# Altium project Smart_Station.PrjPcb
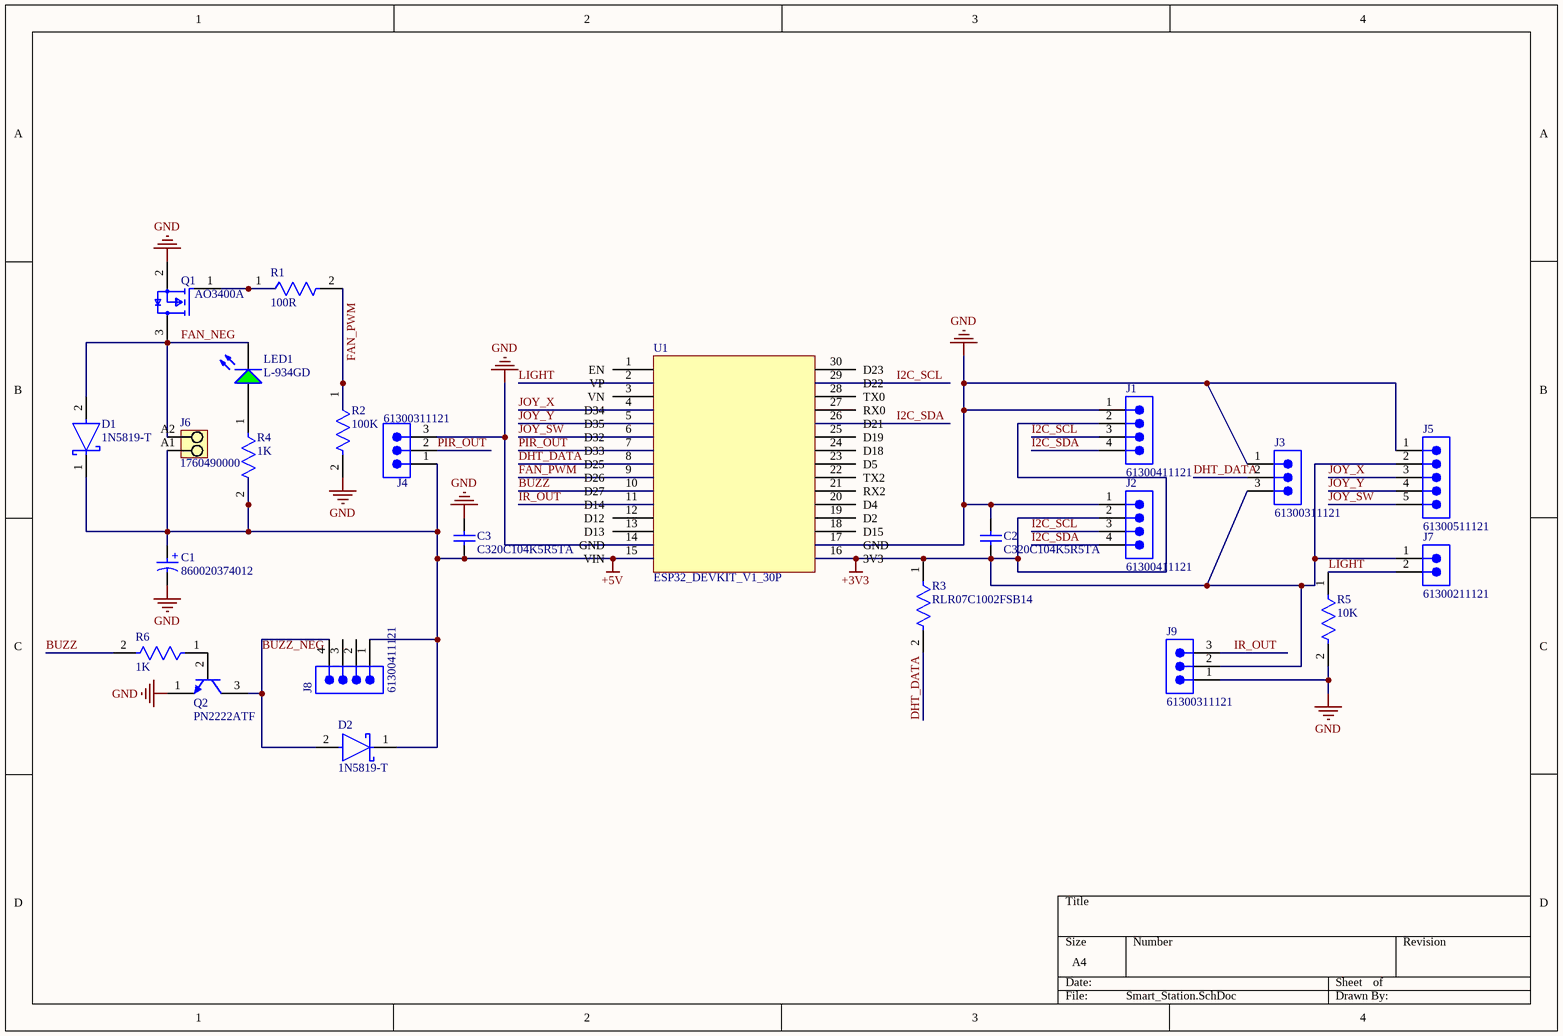
[diagram p0: Smart_Station.SchDoc]
1 sheet, 24 parts. Net scope: global (net labels, ports and power ports of the same name join across sheets).
Board file: Smart_Station.PcbDoc

## Sheet Smart_Station.SchDoc
size A4; SheetNumber: 1; SheetTotal: 1

### Parts
C1  860020374012  [WCAP-ATG5_D8H11.5]
C2  C320C104K5R5TA  [CAPR51-254-508X318X736]
C3  C320C104K5R5TA  [CAPR51-254-508X318X736]
D1  1N5819-T  [FP-DO-41_Plastic-MFG]
D2  1N5819-T  [FP-DO-41_Plastic-MFG]
J1  61300411121  [61300411121]
J2  61300411121  [61300411121]
J3  61300311121  [61300311121]
J4  61300311121  [61300311121]
J5  61300511121  [61300511121]
J6  1760490000  [PM_5_08_90_02]
J7  61300211121  [61300211121]
J8  61300411121  [61300411121]
J9  61300311121  [61300311121]
LED1  L-934GD  [KING-L-934GD]
Q1  AO3400A  [FP-SOT23-MFG]
Q2  PN2222ATF  [FAIR-TO-92-3]
R1  100R  [FP-RLR07-MFG]
R2  100K  [FP-RLR07-MFG]
R3  RLR07C1002FSB14  [FP-RLR07-MFG]
R4  1K  [FP-RLR07-MFG]
R5  10K  [FP-RLR07-MFG]
R6  1K  [FP-RLR07-MFG]
U1  ESP32_DEVKIT_V1_30P  [ESP32_DEVKIT_V1_30P]

### Nets
+3V3: C2.1 J1.2 J2.2 J3.3 J5.2 J7.1 J9.2 R3.1 U1.16(3V3)
+5V: C1.1(P) C3.1 D1.1(C) D2.1(C) J4.1 J6.A1 J8.1 R4.2 U1.15(VIN)
GND: C1.2(N) C2.2 C3.2 J1.1 J2.1 J3.1 J4.3 J5.1 J9.1 Q1.2(S) Q2.1(E) R2.2 R5.2 U1.14(GND) U1.17(GND)
BUZZ: R6.2 U1.10(D27)
BUZZ_NEG: D2.2(A) J8.4 Q2.3(C)
DHT_DATA: J3.2 R3.2 U1.8(D25)
FAN_NEG: D1.2(A) J6.A2 LED1.2(K) Q1.3(D)
FAN_PWM: R1.2 R2.1 U1.9(D26)
I2C_SCL: J1.3 J2.3 U1.29(D22)
I2C_SDA: J1.4 J2.4 U1.26(D21)
IR_OUT: J9.3 U1.11(D14)
JOY_SW: J5.5 U1.6(D32)
JOY_X: J5.3 U1.4(D34)
JOY_Y: J5.4 U1.5(D35)
LIGHT: J7.2 R5.1 U1.2(VP)
PIR_OUT: J4.2 U1.7(D33)
NetLED1_1: LED1.1(A) R4.1
NetQ1_1: Q1.1(G) R1.1
NetQ2_2: Q2.2(B) R6.1

Not connected (* = marked no-connect by the designer): J8 2 3; U1 1(EN) 3(VN) 12(D12) 13(D13) 18(D15) 19(D2) 20(D4) 21(RX2) 22(TX2) 23(D5) 24(D18) 25(D19) 27(RX0) 28(TX0) 30(D23)

### Notes on the sheet
- (in symbol CMP-03913-53914176-1) +

### Library data of the parts
C1 = CMP-03913-53914176-1: 860020374012 WCAP-ATG5 Aluminum Electrolytic Capacitors; Voltage Rating: 16V; Capacitance: 470µF; Tolerance: 20%; Pitch: 3.5mm; Life (Hours): 2000hours; Leakage Current: 75.2µA; Ripple Current: 370mA; Polarity: Polar; NexarPartId: 53914176; Min Operating Temperature: -40°C; Diameter: 8mm; Height - Seated (Max): 13.0048mm; Lead Pitch: 3.5052mm; RoHS: Compliant; Case/Package: Radial; Max Operating Temperature: 105°C; Mount: Through Hole; Length: 11.5mm; Height: 11.5mm; Packaging: Tape & Box (TB); Voltage Rating (DC): 16V
C2 C3 = CMP-1664-00004-1: Radial Leaded Multilayer Ceramic Capacitor, 0.1 uF, +/- 10%, 50 V, -55 to 125 degC, 2-Pin THD, RoHS, Tape and Reel; Case\Package: SOT-23-5; Max Power Dissipation: 250 mW; Output Current: 150 mA; Dropout Voltage: 260 mV; Outputs: 1; Output Voltage: 5 V; Max Input Voltage: 8 V; Min Operating Temperature: -40 degC; Packaging: Tape and Reel; Height: 1.3 mm; Radiation Hardening: No; Pins: 5; ComponentLink1Description: Manufacturer URL; Mount: Surface Mount; RoHSCompliant: true; Max Operating Temperature: 85 degC; PackageReference: CAPR51-254-508X318X736; ComponentLink2URL: http://www.kemet.com/docfinder?Partnumber=C320C104K5R5TA; PackageDescription: 2-Pin Through Hole Device, Body 5.08 x 3.18 mm, Pitch 2.54 mm; ComponentLink1URL: http://www.kemet.com/; Width: 1.8 mm; Package Quantity: 3000; DatasheetVersion: Dec-15; Length: 3 mm; ComponentLink2Description: Datasheet
D1 D2 = CMP-12790-000042-1: DIODE SCHOTTKY 40V 1A DO41; Manufacturer: Diodes Inc.; Description: Diode Schottky 40V 1A Through Hole DO-41; Max Surge Forward Current: 25A; Capacitance: 110 pF; Max Junction Temp: +125°C; Peak Reverse Current: 1mA; Value: 110 pF; Temperature Range Low: -65°C; Footprint Url: https://www.diodes.com/assets/Package-Files/DO-41-Plastic.pdf; Digikey Description: DIODE SCHOTTKY 40V 1A DO41; Category: Diode; Mouser Description: Schottky Diodes & Rectifiers Vr/40V Io/1A T/R; Device Class L2: Diodes; Temperature Range High: +125°C; RoHS: TRUE; Device Class L3: Schottky Diodes; ComponentLink2Description: Datasheet; Temperature: -65°C to +125°C; Reverse Voltage: 40V; Height: 2.72mm; ComponentLink2URL: https://www.diodes.com/assets/Datasheets/ds23001.pdf; Forward Current: 1A; Manufacturer Part Number: 1N5819-T; Lead Free: Yes; Device Class L1: Discrete Semiconductors; Max Repetitive Reverse Voltage: 40V; Ipc Land Pattern Name: DIOPA1091W105L521D272; Automotive: No; Package: DO-41 (Plastic); Octopart: https://octopart.com/1n5819-t-diodes+inc.-55389586
J1 J2 J8 = CMP-1502-01064-4: THT Vertical Pin Header WR-PHD, Pitch 2.54 mm, Single Row, 4 pins; Connector Type: Male Pin; Gender: Male; Current Rating: 3A; Number of Positions: 4; Operating Supply Voltage: 250V; Contact Resistance: 20mΩ; Pitch: 2.54mm; Max Operating Temperature: 105°C; Mount: Through Hole; Contact Material: Gold; Contact Plating: Gold; Number of Contacts: 4; Orientation: Vertical; Packaging: Bulk; Contact Mating Length: 5.9944mm; Voltage Rating: 250V; Number of Rows: 1; Height: 8.89mm; Lead Free: Lead Free; Lead Pitch: 2.54mm; Number of Pins: 4; Color: Black; Min Operating Temperature: -40°C; RoHS: Compliant; Termination: Solder
J3 J4 J9 = CMP-1502-01062-4: THT Vertical Pin Header WR-PHD, Pitch 2.54 mm, Single Row, 3 pins; Connector Type: Male Pin; Number of Contacts: 3; Operating Supply Voltage: 250V; Current Rating: 3A; Pitch: 2.54mm; Contact Resistance: 20mΩ; Gender: Male; Height: 8.94mm; Color: Black; Min Operating Temperature: -40°C; Max Operating Temperature: 105°C; Mount: Through Hole; Termination: Solder; Number of Rows: 1; Packaging: Bulk; Number of Pins: 3; Lead Pitch: 2.54mm; RoHS: Compliant; Contact Plating: Gold; Number of Positions: 3; Lead Free: Lead Free; Voltage Rating: 250V; Contact Mating Length: 5.9944mm; Orientation: Vertical; Contact Material: Gold
J5 = CMP-1502-01068-4: THT Vertical Pin Header WR-PHD, Pitch 2.54 mm, Single Row, 5 pins; Number of Contacts: 5; Connector Type: Male Pin; Operating Supply Voltage: 250V; Contact Resistance: 20mΩ; Gender: Male; Pitch: 2.54mm; Current Rating: 3A; Min Operating Temperature: -40°C; Contact Material: Gold; Color: Black; RoHS: Compliant; Number of Rows: 1; Lead Free: Lead Free; Height: 8.89mm; Contact Plating: Gold; Number of Pins: 5; Orientation: Vertical; Voltage Rating: 250V; Packaging: Bulk; Number of Positions: 5; Max Operating Temperature: 105°C; Termination: Solder; Lead Pitch: 2.54mm; Contact Mating Length: 5.9944mm; Mount: Through Hole
J6 = CMP-1559-01627-1: OMNIMATE Signal - series PM; Manufacturer: Weidmueller; Contact_surface: tinned; Pitch_mm: 5,08 mm; Solid_min_H05_07_V_U: 0,13 mm²; Wire_cross_section_AWG_min_UL_1059: AWG 26; Wire_cross_section_AWG_max_UL_1059: AWG 14; Rated_voltage_for_surge_voltage_class_pollution_degree_II_2: 600 V; Rated_current_use_group_B_UL_1059: 15 A; Mounting_onto_the_PCB: Solder connection; Solder_pin_length_mm: 3,5 mm; Side_termination_characteristic: closed side; Contact_material: Cu-Leg; Pitch_inch: 0,2 inch; No_of_poles: 2; UL_94_flammability_rating: V-0; Insulating_material: Wemid (PA); Rated_voltage_use_group_B_UL_1059: 300 V; Solid_max_H05_07_V_U: 2,5 mm²; Short_text_for_material: PM 5.08/02/90 3.5SN OR BX; Revision: V1; PartNumber: 1760490000; Qty: 500 PCS; ComponentLink2Description: URL Link1; Packaging: Box; PackageReference: PM_5_08_90_02; ComponentLink2URL: http://catalog.weidmueller.com/catalog/Start.do?localeId=en&ObjectID=1760490000; Colour: Orange; ComponentLink1Description: Manufacturer URL; ComponentLink1URL: http://www.weidmueller.com/
J7 = CMP-1712-00002-7: THT Vertical Pin Header WR-PHD, Pitch 2.54 mm, Single Row, 2 pins; Pitch: 2.54mm; Number of Contacts: 2; Connector Type: Male Pin; Gender: Male; Contact Resistance: 20mΩ; Operating Supply Voltage: 250V; Current Rating: 3A; Housing Material: PBT; RoHS: Compliant; Lead Free: Lead Free; Contact Material: Gold; REACH SVHC: No; Min Operating Temperature: -40°C; Termination: Through Hole; Number of Pins: 2; Contact Gender: Male; Packaging: Bulk; Lead Pitch: 2.54mm; Contact Plating: Gold; Orientation: Vertical; Mount: Through Hole; Height: 8.94mm; Color: Black; Number of Positions: 2; Contact Mating Length: 5.9944mm; Max Operating Temperature: 105°C; Voltage Rating: 250V; Number of Rows: 1
LED1 = CMP-2000-06531-1: Green Diffused LED, 2.2 V, -40 to 85 degC, 2-Pin THD, RoHS; Manufacturer: Kingbright; Viewing Angle: 60°; LED Material: GaP; Dominant Wavelength: 568nm; Lens Shape: Round; Forward Voltage: 2.2V; Luminous Intensity: 20mcd; Number of LEDs: 1; Datasheet URL: https://datasheet.ciiva.com/11773/0900766b801ff775-11773480.pdf; Package Reference: L-934GD; Series: Round; Manufacturer URL: http://www.kingbright.com/; Package Type: 3mm(T-1); Dimensions: 3x4.6mm; Package Description: 2-Pin Through Hole Device, Dia 3.2 mm, Body Length 4.9 mm; Datasheet Version: Rev. 1, 09/2001; Mounting Technology: ThroughHole; Number of Pins: 2; Lens Colour: Green; LED Colours: Green; Mounting Type: ThroughHole
Q1 = CMP-83955-000006-1: MOSFET N-CH 30V 5.7A SOT23; Input Capacitance: 630pF; Number of Elements: 1; Rds On Max: 26.5mR; Max Power Dissipation: 1.4W; Gate to Source Voltage (Vgs): 12V; Min Operating Temperature: -55°C; Lead Free: Lead Free; Number of Pins: 3; Drain to Source Voltage (Vdss): 30V; Case/Package: SOT-23; Mount: Surface Mount; Continuous Drain Current (ID): 5.7A; Radiation Hardening: No; Packaging: Tape and Reel; Max Operating Temperature: 150°C; Power Dissipation: 1.4W
Q2 = CMP-2000-06911-1: NPN General-Purpose Amplifier, 40 V, -55 to 150 degC, 3-Pin TO-92, RoHS, Tape and Reel; Manufacturer: FairchildSemiconductor; Configuration: Single; Collector-Emitter Saturation Voltage: 1V; Collector- Emitter Voltage VCEO Max: 40V; Unit Weight: 0.008466oz; Maximum DC Collector Current: 1A; DC Collector/Base Gain hfe Min: 100; Emitter- Base Voltage VEBO: 6V; Maximum Power Dissipation: 625mW; DC Current Gain hFE Max: 300; Gain Bandwidth Product fT: 300MHz; Collector- Base Voltage VCBO: 75V; Mounting Style: ThroughHole; Package Description: 3-Pin Transistor Outline Package, Body Dia 4.79 mm, Pitch 2.6 mm; Mounting Technology: ThroughHole; RoHS: Details; Brand: FairchildSemiconductor; Minimum Operating Temperature: -55C; Package / Case: TO-92-3KinkedLead; Package Reference: TO-92; Series: PN2222; Packaging: Reel; Datasheet Version: Rev. 1.1.0, 07/2014; Datasheet URL: https://www.fairchildsemi.com/datasheets/PN/PN2222A.pdf; Maximum Operating Temperature: +150C; Transistor Polarity: NPN; Factory Pack Quantity: 2000; Manufacturer URL: https://www.fairchildsemi.com/; <PCN>: http://www.mouser.com/PCN/3.26.10LTBDFairchild.pdf; Product Category: BipolarTransistors-BJT
R1-R6 = CMP-00030-39449004-1: RLR07C1002FSB14 Fixed Resistor, Metal Film, 0.25W, 10000ohm, 250V, 1% +/-Tol, 100ppm/Cel, Through Hole Mount; Power Rating: 250mW; Lead Diameter: 640µm; Wire/Cable Diameter: 50.8µm; Lead Length: 38.1mm; Resistance: 10kΩ; Temperature Coefficient: 100ppm/°C; Military Standard: MIL-PRF-39017; Max Operating Temperature: 150°C; Width: 2.29mm; Mount: Through Hole; Composition: Metal Film; REACH SVHC: Unknown; Tolerance: 1%; Failure Rate: 0.001%; Min Operating Temperature: -65°C; Voltage Rating: 250V; Schedule B: 8533210090, 8533210090; Max Power Dissipation: 250mW; Length: 7.62mm; Case/Package: Conformal; Lead Free: Contains Lead; NexarPartId: 39449004; Radiation Hardening: No; Termination: Axial; Number of Pins: 14; RoHS: Non-Compliant; Packaging: Bulk; Features: Military, Moisture Resistant, Weldable; Number of Terminations: 2; Contact Plating: Lead, Tin; Diameter: 2.29mm; Voltage Rating (DC): 250V